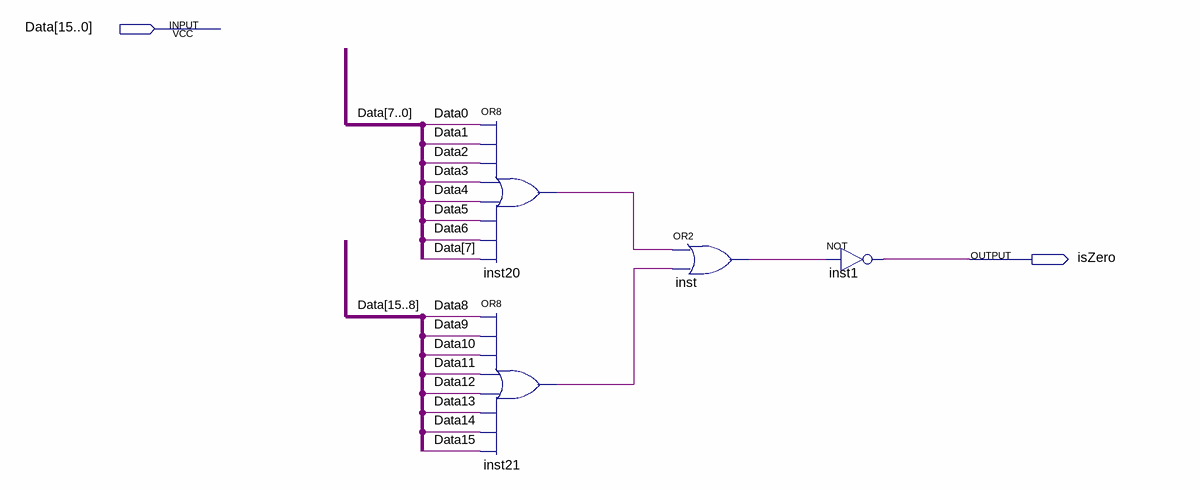
[diagram p0: schematic sheet]
// Quartus schematic checkZero.bdf as structural Verilog: 4 symbols, 2 pins
module checkZero (
  input  [15:0] Data,
  output isZero
);

  wire inst20_out, inst21_out, inst_out;

  or inst20 (inst20_out, Data[0], Data[1], Data[2], Data[3], Data[4], Data[5], Data[6], Data[7]);
  or inst21 (inst21_out, Data[8], Data[9], Data[10], Data[11], Data[12], Data[13], Data[14], Data[15]);
  or inst (inst_out, inst20_out, inst21_out);
  not inst1 (isZero, inst_out);
endmodule
